# Altium schematic sheet SAR_TopLevel.SchDoc
size A; SheetNumber: 1; SheetTotal: 9
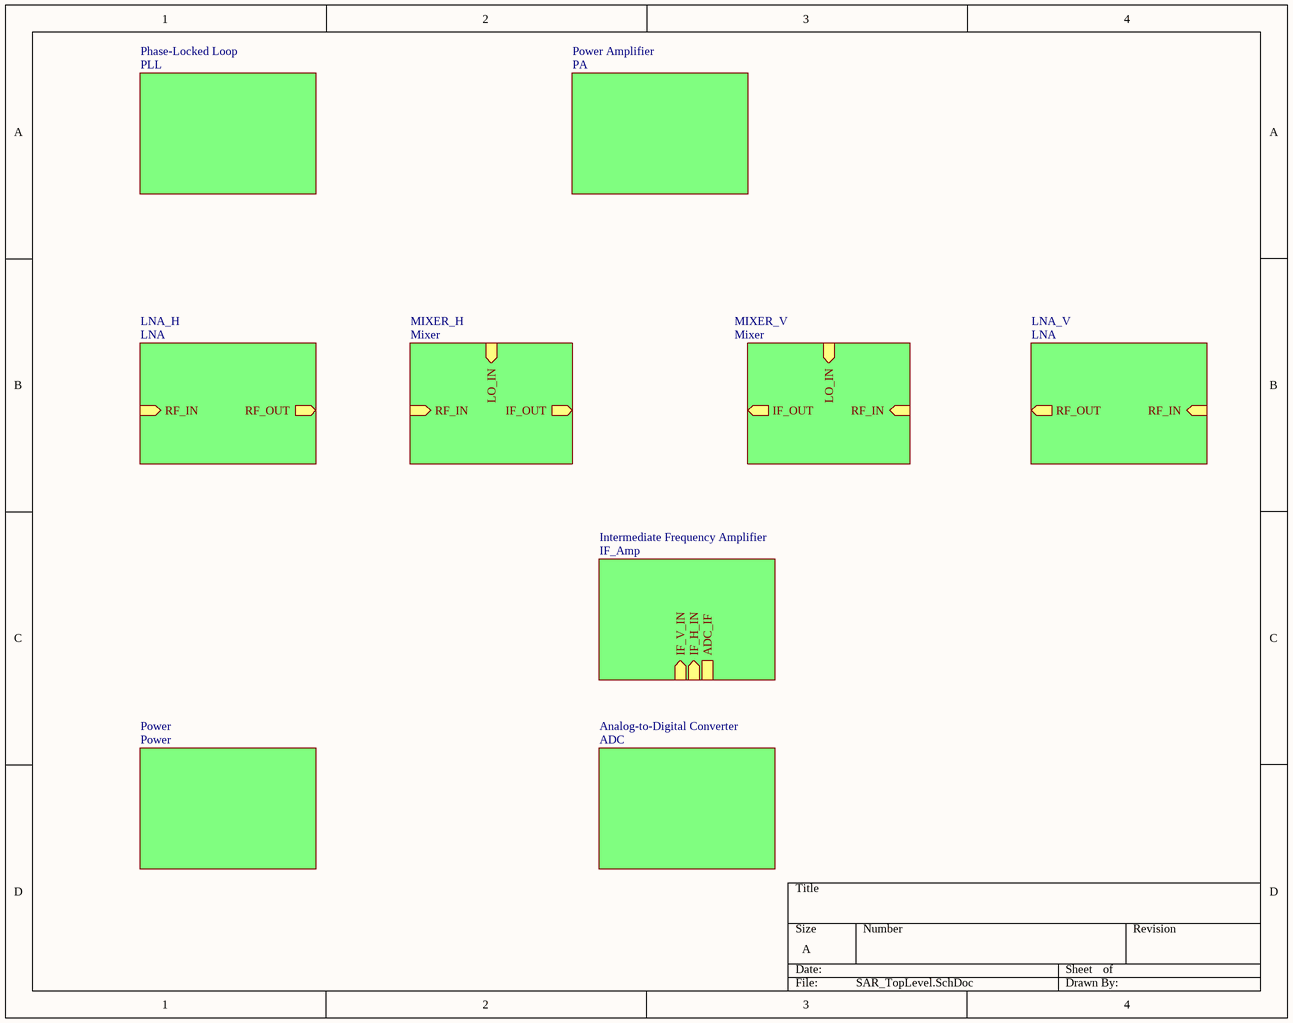
[diagram p0: SAR_TopLevel.SchDoc]

## Sub-sheets
Analog-to-Digital Converter = ADC: no entries
Intermediate Frequency Amplifier = IF_Amp: IF_V_IN (in), IF_H_IN (in), ADC_IF (harness ADC_IF)
LNA_H = LNA: RF_IN (in), RF_OUT (out)
LNA_V = LNA: RF_IN (in), RF_OUT (out)
MIXER_H = Mixer: RF_IN (in), IF_OUT (out), LO_IN (in)
MIXER_V = Mixer: LO_IN (in), RF_IN (in), IF_OUT (out)
Phase-Locked Loop = PLL: no entries
Power = Power: no entries
Power Amplifier = PA: no entries